# Altium schematic sheet CORE_DEFG.SchDoc: Explorer STM32F407 Board
size A4; Author: ATOM@ALIENTEK; Revision: V3.4; SheetSize: A4
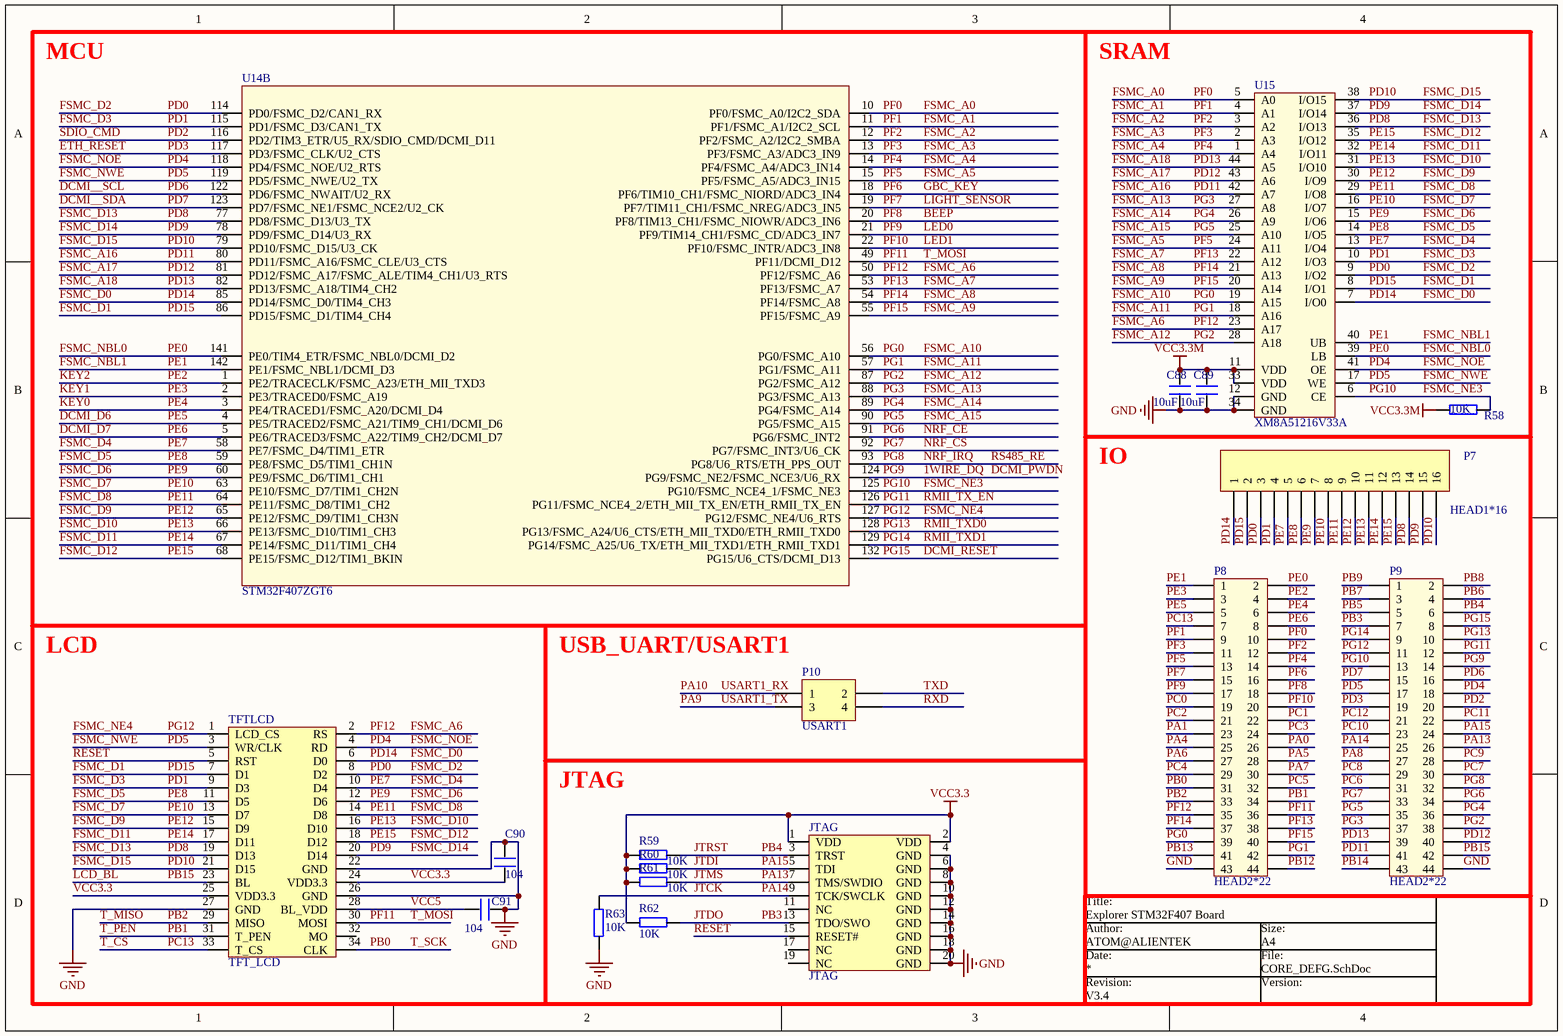
[diagram p0: CORE_DEFG.SchDoc]

## Parts
C88  10uF  [0402]
C89  10uF  [0402]
C90  104  [0402]
C91  104  [0402]
JTAG  JTAG  [JTAG_20]
P7  HEAD1*16  [HDR1X16]
P8  HEAD2*22  [HEAD2*22]
P9  HEAD2*22  [HEAD2*22]
P10  USART1  [HDR2X2]
R58  10K  [0402]
R59  10K  [0402]
R60  10K  [0402]
R61  10K  [0402]
R62  10K  [0402]
R63  10K  [0402]
TFTLCD  TFT_LCD  [db2*17-4.3]
U14  STM32F407ZGT6  [LQFP144]  (part B of 2)
U15  XM8A51216V33A  [TSOP44]

## Nets
GND: C88.1 C89.1 C90.2 C91.1 JTAG.4(GND) JTAG.6(GND) JTAG.8(GND) JTAG.10(GND) JTAG.12(GND) JTAG.14(GND) JTAG.16(GND) JTAG.18(GND) JTAG.20(GND) P8.43 P9.44 R63.2 TFTLCD.22(GND) TFTLCD.26(GND) TFTLCD.27(GND) U15.12(GND) U15.34(GND)
VCC3.3: C90.1 JTAG.1(VDD) JTAG.2(VDD) R59.2 R60.2 R61.2 R62.2 TFTLCD.24(VDD3.3) TFTLCD.25(VDD3.3)
VCC3.3M: C88.2 C89.2 R58.2 U15.11(VDD) U15.33(VDD)
1WIRE_DQ: P9.14 U14.124(PG9/FSMC_NE2/FSMC_NCE3/U6_RX)  [also labelled DCMI_PWDN, PG9]
BEEP: P8.18 U14.20(PF8/TIM13_CH1/FSMC_NIOWR/ADC3_IN6)  [also labelled PF8]
DCMI__SCL: P9.16 U14.122(PD6/FSMC_NWAIT/U2_RX)  [also labelled PD6]
DCMI__SDA: P9.15 U14.123(PD7/FSMC_NE1/FSMC_NCE2/U2_CK)  [also labelled PD7]
DCMI_D6: P8.5 U14.4(PE5/TRACED2/FSMC_A21/TIM9_CH1/DCMI_D6)  [also labelled PE5]
DCMI_D7: P8.8 U14.5(PE6/TRACED3/FSMC_A22/TIM9_CH2/DCMI_D7)  [also labelled PE6]
DCMI_RESET: P9.8 U14.132(PG15/U6_CTS/DCMI_D13)  [also labelled PG15]
ETH_RESET: P9.19 U14.117(PD3/FSMC_CLK/U2_CTS)  [also labelled PD3]
FSMC_A0: P8.10 U14.10(PF0/FSMC_A0/I2C2_SDA) U15.5(A0)  [also labelled PF0]
FSMC_A1: P8.9 U14.11(PF1/FSMC_A1/I2C2_SCL) U15.4(A1)  [also labelled PF1]
FSMC_A2: P8.12 U14.12(PF2/FSMC_A2/I2C2_SMBA) U15.3(A2)  [also labelled PF2]
FSMC_A3: P8.11 U14.13(PF3/FSMC_A3/ADC3_IN9) U15.2(A3)  [also labelled PF3]
FSMC_A4: P8.14 U14.14(PF4/FSMC_A4/ADC3_IN14) U15.1(A4)  [also labelled PF4]
FSMC_A5: P8.13 U14.15(PF5/FSMC_A5/ADC3_IN15) U15.24(A11)  [also labelled PF5]
FSMC_A6: P8.35 TFTLCD.2(RS) U14.50(PF12/FSMC_A6) U15.23(A17)  [also labelled PF12]
FSMC_A7: P8.38 U14.53(PF13/FSMC_A7) U15.22(A12)  [also labelled PF13]
FSMC_A8: P8.37 U14.54(PF14/FSMC_A8) U15.21(A13)  [also labelled PF14]
FSMC_A9: P8.40 U14.55(PF15/FSMC_A9) U15.20(A14)  [also labelled PF15]
FSMC_A10: P8.39 U14.56(PG0/FSMC_A10) U15.19(A15)  [also labelled PG0]
FSMC_A11: P8.42 U14.57(PG1/FSMC_A11) U15.18(A16)  [also labelled PG1]
FSMC_A12: P9.38 U14.87(PG2/FSMC_A12) U15.28(A18)  [also labelled PG2]
FSMC_A13: P9.37 U14.88(PG3/FSMC_A13) U15.27(A8)  [also labelled PG3]
FSMC_A14: P9.36 U14.89(PG4/FSMC_A14) U15.26(A9)  [also labelled PG4]
FSMC_A15: P9.35 U14.90(PG5/FSMC_A15) U15.25(A10)  [also labelled PG5]
FSMC_A16: P9.41 U14.80(PD11/FSMC_A16/FSMC_CLE/U3_CTS) U15.42(A7)  [also labelled PD11]
FSMC_A17: P9.40 U14.81(PD12/FSMC_A17/FSMC_ALE/TIM4_CH1/U3_RTS) U15.43(A6)  [also labelled PD12]
FSMC_A18: P9.39 U14.82(PD13/FSMC_A18/TIM4_CH2) U15.44(A5)  [also labelled PD13]
FSMC_D0: P7.1 TFTLCD.6(D0) U14.85(PD14/FSMC_D0/TIM4_CH3) U15.7(I/O0)  [also labelled PD14]
FSMC_D1: P7.2 TFTLCD.7(D1) U14.86(PD15/FSMC_D1/TIM4_CH4) U15.8(I/O1)  [also labelled PD15]
FSMC_D2: P7.3 TFTLCD.8(D2) U14.114(PD0/FSMC_D2/CAN1_RX) U15.9(I/O2)  [also labelled PD0]
FSMC_D3: P7.4 TFTLCD.9(D3) U14.115(PD1/FSMC_D3/CAN1_TX) U15.10(I/O3)  [also labelled PD1]
FSMC_D4: P7.5 TFTLCD.10(D4) U14.58(PE7/FSMC_D4/TIM1_ETR) U15.13(I/O4)  [also labelled PE7]
FSMC_D5: P7.6 TFTLCD.11(D5) U14.59(PE8/FSMC_D5/TIM1_CH1N) U15.14(I/O5)  [also labelled PE8]
FSMC_D6: P7.7 TFTLCD.12(D6) U14.60(PE9/FSMC_D6/TIM1_CH1) U15.15(I/O6)  [also labelled PE9]
FSMC_D7: P7.8 TFTLCD.13(D7) U14.63(PE10/FSMC_D7/TIM1_CH2N) U15.16(I/O7)  [also labelled PE10]
FSMC_D8: P7.9 TFTLCD.14(D8) U14.64(PE11/FSMC_D8/TIM1_CH2) U15.29(I/O8)  [also labelled PE11]
FSMC_D9: P7.10 TFTLCD.15(D9) U14.65(PE12/FSMC_D9/TIM1_CH3N) U15.30(I/O9)  [also labelled PE12]
FSMC_D10: P7.11 TFTLCD.16(D10) U14.66(PE13/FSMC_D10/TIM1_CH3) U15.31(I/O10)  [also labelled PE13]
FSMC_D11: P7.12 TFTLCD.17(D11) U14.67(PE14/FSMC_D11/TIM1_CH4) U15.32(I/O11)  [also labelled PE14]
FSMC_D12: P7.13 TFTLCD.18(D12) U14.68(PE15/FSMC_D12/TIM1_BKIN) U15.35(I/O12)  [also labelled PE15]
FSMC_D13: P7.14 TFTLCD.19(D13) U14.77(PD8/FSMC_D13/U3_TX) U15.36(I/O13)  [also labelled PD8]
FSMC_D14: P7.15 TFTLCD.20(D14) U14.78(PD9/FSMC_D14/U3_RX) U15.37(I/O14)  [also labelled PD9]
FSMC_D15: P7.16 TFTLCD.21(D15) U14.79(PD10/FSMC_D15/U3_CK) U15.38(I/O15)  [also labelled PD10]
FSMC_NBL0: P8.2 U14.141(PE0/TIM4_ETR/FSMC_NBL0/DCMI_D2) U15.39(LB)  [also labelled PE0]
FSMC_NBL1: P8.1 U14.142(PE1/FSMC_NBL1/DCMI_D3) U15.40(UB)  [also labelled PE1]
FSMC_NE3: P9.13 R58.1 U14.125(PG10/FSMC_NCE4_1/FSMC_NE3) U15.6(CE)  [also labelled PG10]
FSMC_NE4: P9.11 TFTLCD.1(LCD_CS) U14.127(PG12/FSMC_NE4/U6_RTS)  [also labelled PG12]
FSMC_NOE: P9.18 TFTLCD.4(RD) U14.118(PD4/FSMC_NOE/U2_RTS) U15.41(OE)  [also labelled PD4]
FSMC_NWE: P9.17 TFTLCD.3(WR/CLK) U14.119(PD5/FSMC_NWE/U2_TX) U15.17(WE)  [also labelled PD5]
GBC_KEY: P8.16 U14.18(PF6/TIM10_CH1/FSMC_NIORD/ADC3_IN4)  [also labelled PF6]
JTCK: JTAG.9(TCK/SWCLK) P9.25 R63.1  [also labelled PA14]
JTDI: JTAG.5(TDI) P9.24 R60.1  [also labelled PA15]
JTDO: JTAG.13(TDO/SWO) P9.7 R62.1  [also labelled PB3]
JTMS: JTAG.7(TMS/SWDIO) P9.26 R61.1  [also labelled PA13]
JTRST: JTAG.3(TRST) P9.6 R59.1  [also labelled PB4]
KEY0: P8.6 U14.3(PE4/TRACED1/FSMC_A20/DCMI_D4)  [also labelled PE4]
KEY1: P8.3 U14.2(PE3/TRACED0/FSMC_A19)  [also labelled PE3]
KEY2: P8.4 U14.1(PE2/TRACECLK/FSMC_A23/ETH_MII_TXD3)  [also labelled PE2]
LCD_BL: P9.42 TFTLCD.23(BL)  [also labelled PB15]
LED0: P8.17 U14.21(PF9/TIM14_CH1/FSMC_CD/ADC3_IN7)  [also labelled PF9]
LED1: P8.20 U14.22(PF10/FSMC_INTR/ADC3_IN8)  [also labelled PF10]
LIGHT_SENSOR: P8.15 U14.19(PF7/TIM11_CH1/FSMC_NREG/ADC3_IN5)  [also labelled PF7]
NRF_CE: P9.34 U14.91(PG6/FSMC_INT2)  [also labelled PG6]
NRF_CS: P9.33 U14.92(PG7/FSMC_INT3/U6_CK)  [also labelled PG7]
NRF_IRQ: P9.32 U14.93(PG8/U6_RTS/ETH_PPS_OUT)  [also labelled PG8, RS485_RE]
PA0: P8.26
PA1: P8.23
PA4: P8.25
PA5: P8.28
PA6: P8.27
PA7: P8.30
PA8: P9.27
PA9: P10.3  [also labelled USART1_TX]
PA10: P10.1  [also labelled USART1_RX]
PB0: P8.31 TFTLCD.34(CLK)  [also labelled T_SCK]
PB1: P8.34 TFTLCD.31(T_PEN)  [also labelled T_PEN]
PB2: P8.33 TFTLCD.29(MISO)  [also labelled T_MISO]
PB5: P9.5
PB6: P9.4
PB7: P9.3
PB8: P9.2
PB9: P9.1
PB12: P8.44
PB13: P8.41
PB14: P9.43
PC0: P8.19
PC1: P8.22
PC2: P8.21
PC3: P8.24
PC4: P8.29
PC5: P8.32
PC6: P9.31
PC7: P9.30
PC8: P9.29
PC9: P9.28
PC10: P9.23
PC11: P9.22
PC12: P9.21
PC13: P8.7 TFTLCD.33(T_CS)  [also labelled T_CS]
PD2: P9.20 U14.116(PD2/TIM3_ETR/U5_RX/SDIO_CMD/DCMI_D11)  [also labelled SDIO_CMD]
PF11: P8.36 TFTLCD.30(MOSI) U14.49(PF11/DCMI_D12)  [also labelled T_MOSI]
PG11: P9.12 U14.126(PG11/FSMC_NCE4_2/ETH_MII_TX_EN/ETH_RMII_TX_EN)  [also labelled RMII_TX_EN]
PG13: P9.10 U14.128(PG13/FSMC_A24/U6_CTS/ETH_MII_TXD0/ETH_RMII_TXD0)  [also labelled RMII_TXD0]
PG14: P9.9 U14.129(PG14/FSMC_A25/U6_TX/ETH_MII_TXD1/ETH_RMII_TXD1)  [also labelled RMII_TXD1]
RESET: JTAG.15(RESET#) TFTLCD.5(RST)
RXD: P10.4
TXD: P10.2
VCC5: C91.2 TFTLCD.28(BL_VDD)

Not connected (* = marked no-connect by the designer): JTAG 11(NC) 17(NC) 19(NC); TFTLCD 32(MO)

## Notes on the sheet
- MCU
- SRAM
- IO
- LCD
- USB_UART/USART1
- JTAG
- Title:
- Author:
- Date:
- Revision:
- Size:
- File:
- Version:

## Library data of the parts
C88-C91 = C
P7 = Header 16: Header, 16-Pin; LatestRevisionDate: 17-Jul-2002; LatestRevisionNote: Re-released for DXP Platform.; Publisher: Altium Limited
P10 = Header 2X2: Header, 2-Pin, Dual row; LatestRevisionDate: 17-Jul-2002; LatestRevisionNote: Re-released for DXP Platform.; Publisher: Altium Limited
R58-R63 = R
U14 = STM32F407ZET6
U15 = IS62WV51216